# Altium schematic sheet LTC6952_1.SchDoc
size A3
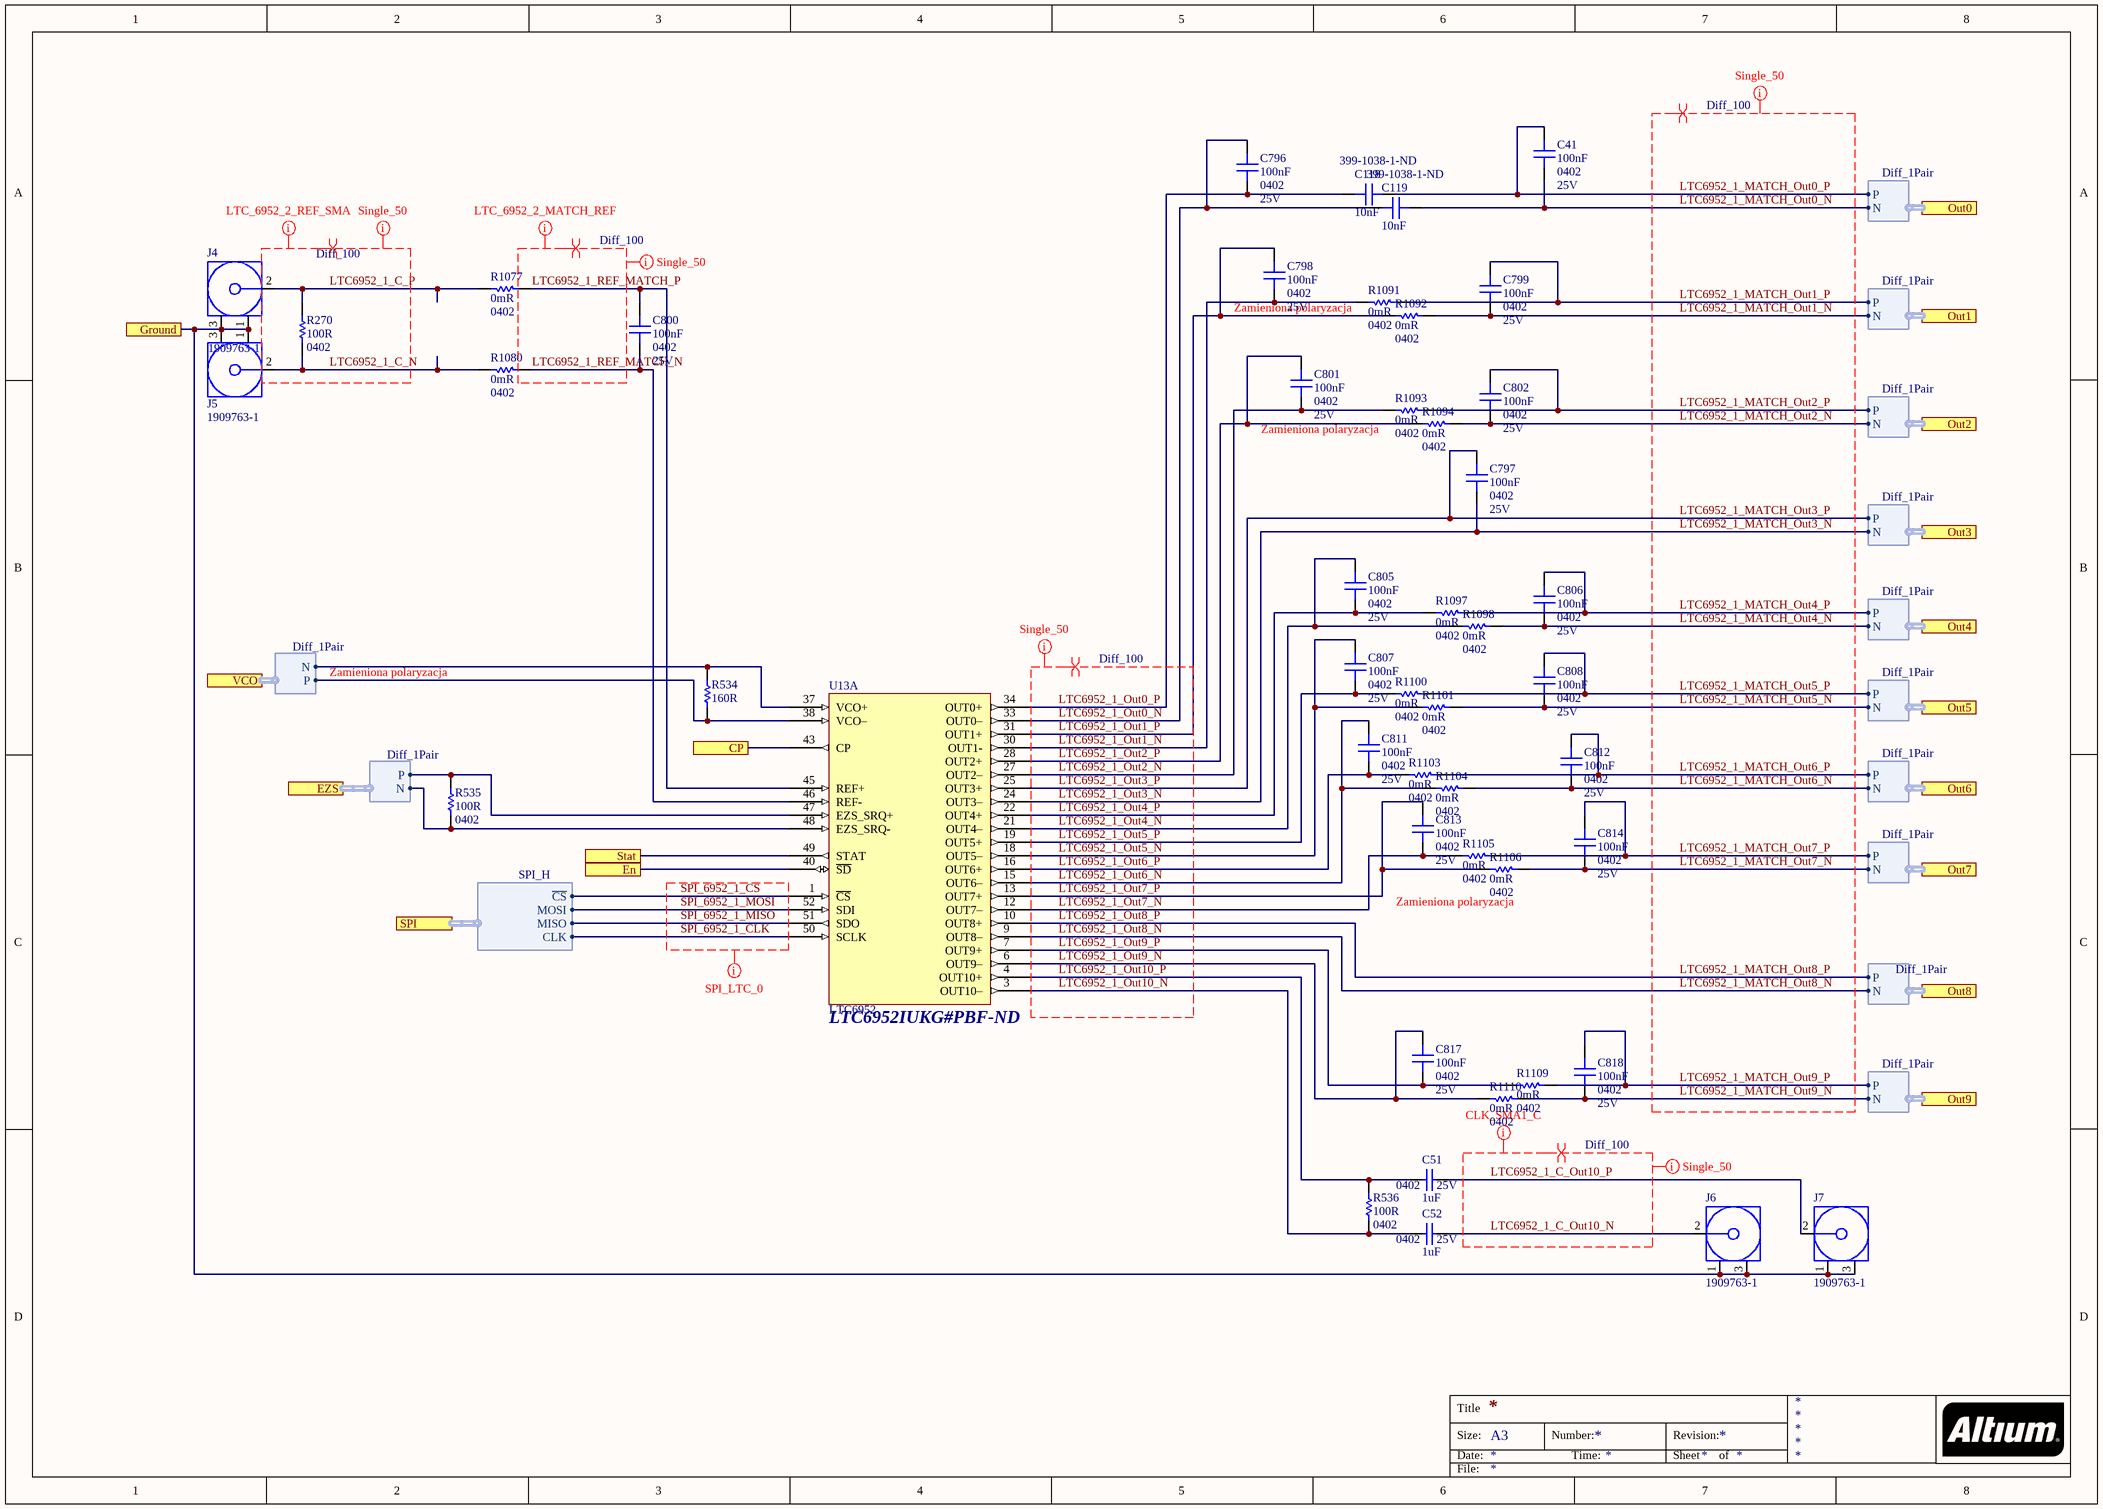
[diagram p0: LTC6952_1.SchDoc]

## Parts
C41  100nF  Case/Package: 0402  Voltage Rating: 25V  [CAP 0402/1005 KK]
C51  1uF  Case/Package: 0402  Voltage Rating: 25V  [CAP 0402/1005 KK]
C52  1uF  Case/Package: 0402  Voltage Rating: 25V  [CAP 0402/1005 KK]
C118  10nF  Supplier Part Number 1: 399-1038-1-ND  [CAP 0402/1005 KK]
C119  10nF  Supplier Part Number 1: 399-1038-1-ND  [CAP 0402/1005 KK]
C796  100nF  Case/Package: 0402  Voltage Rating: 25V  [CAP 0402/1005 KK]
C797  100nF  Case/Package: 0402  Voltage Rating: 25V  [CAP 0402/1005 KK]
C798  100nF  Case/Package: 0402  Voltage Rating: 25V  [CAP 0402/1005 KK]
C799  100nF  Case/Package: 0402  Voltage Rating: 25V  [CAP 0402/1005 KK]
C800  100nF  Case/Package: 0402  Voltage Rating: 25V  [CAP 0402/1005 KK]
C801  100nF  Case/Package: 0402  Voltage Rating: 25V  [CAP 0402/1005 KK]
C802  100nF  Case/Package: 0402  Voltage Rating: 25V  [CAP 0402/1005 KK]
C805  100nF  Case/Package: 0402  Voltage Rating: 25V  [CAP 0402/1005 KK]
C806  100nF  Case/Package: 0402  Voltage Rating: 25V  [CAP 0402/1005 KK]
C807  100nF  Case/Package: 0402  Voltage Rating: 25V  [CAP 0402/1005 KK]
C808  100nF  Case/Package: 0402  Voltage Rating: 25V  [CAP 0402/1005 KK]
C811  100nF  Case/Package: 0402  Voltage Rating: 25V  [CAP 0402/1005 KK]
C812  100nF  Case/Package: 0402  Voltage Rating: 25V  [CAP 0402/1005 KK]
C813  100nF  Case/Package: 0402  Voltage Rating: 25V  [CAP 0402/1005 KK]
C814  100nF  Case/Package: 0402  Voltage Rating: 25V  [CAP 0402/1005 KK]
C817  100nF  Case/Package: 0402  Voltage Rating: 25V  [CAP 0402/1005 KK]
C818  100nF  Case/Package: 0402  Voltage Rating: 25V  [CAP 0402/1005 KK]
J4  1909763-1  [TECO-1909763-1_V]
J5  1909763-1  [TECO-1909763-1_V]
J6  1909763-1  [TECO-1909763-1_V]
J7  1909763-1  [TECO-1909763-1_V]
R270  100R  Case/Package: 0402  [RES 0402/1005 RF KK]
R534  160R  [RES 0402/1005 RF KK]
R535  100R  Case/Package: 0402  [RES 0402/1005 RF KK]
R536  100R  Case/Package: 0402  [RES 0402/1005 RF KK]
R1077  0mR  Case/Package: 0402  [RES 0402/1005 RF KK]
R1080  0mR  Case/Package: 0402  [RES 0402/1005 RF KK]
R1091  0mR  Case/Package: 0402  [RES 0402/1005 RF KK]
R1092  0mR  Case/Package: 0402  [RES 0402/1005 RF KK]
R1093  0mR  Case/Package: 0402  [RES 0402/1005 RF KK]
R1094  0mR  Case/Package: 0402  [RES 0402/1005 RF KK]
R1097  0mR  Case/Package: 0402  [RES 0402/1005 RF KK]
R1098  0mR  Case/Package: 0402  [RES 0402/1005 RF KK]
R1100  0mR  Case/Package: 0402  [RES 0402/1005 RF KK]
R1101  0mR  Case/Package: 0402  [RES 0402/1005 RF KK]
R1103  0mR  Case/Package: 0402  [RES 0402/1005 RF KK]
R1104  0mR  Case/Package: 0402  [RES 0402/1005 RF KK]
R1105  0mR  Case/Package: 0402  [RES 0402/1005 RF KK]
R1106  0mR  Case/Package: 0402  [RES 0402/1005 RF KK]
R1109  0mR  Case/Package: 0402  [RES 0402/1005 RF KK]
R1110  0mR  Case/Package: 0402  [RES 0402/1005 RF KK]
U13  LTC6952  Supplier Part Number 1: LTC6952IUKG#PBF-ND  [LTC6952]  (part A of 2)

## Ports
CP, En, EZS (harness Diff_1Pair), Ground, Out0 (harness Diff_1Pair), Out1 (harness Diff_1Pair), Out2 (harness Diff_1Pair), Out3 (harness Diff_1Pair), Out4 (harness Diff_1Pair), Out5 (harness Diff_1Pair), Out6 (harness Diff_1Pair), Out7 (harness Diff_1Pair), Out8 (harness Diff_1Pair), Out9 (harness Diff_1Pair), SPI (harness SPI_H), Stat, VCO (harness Diff_1Pair)

## Harnesses
SPI_H: CLK, MISO, MOSI, ~{CS}
Diff_1Pair: N, P

## Nets
CP: U13.43(CP) ; port CP
En: U13.40(~{SD}) ; port En
Ground: J4.1 J4.3 J5.1 J5.3 J6.1 J6.3 J7.1 J7.3 ; port Ground
LTC6952_1_C_N: J5.2 R270.1 R1080.2
LTC6952_1_C_Out10_N: C52.1 J6.2
LTC6952_1_C_Out10_P: C51.1 J7.2
LTC6952_1_C_P: J4.2 R270.2 R1077.2
LTC6952_1_MATCH_Out0_N: C41.2 C119.2 ; port Out0.N
LTC6952_1_MATCH_Out0_P: C41.1 C118.2 ; port Out0.P
LTC6952_1_MATCH_Out1_N: C799.2 R1092.1 ; port Out1.N
LTC6952_1_MATCH_Out1_P: C799.1 R1091.1 ; port Out1.P
LTC6952_1_MATCH_Out2_N: C802.2 R1094.1 ; port Out2.N
LTC6952_1_MATCH_Out2_P: C802.1 R1093.1 ; port Out2.P
LTC6952_1_MATCH_Out3_N: C797.2 U13.24(OUT3–) ; port Out3.N  [also labelled LTC6952_1_Out3_N]
LTC6952_1_MATCH_Out3_P: C797.1 U13.25(OUT3+) ; port Out3.P  [also labelled LTC6952_1_Out3_P]
LTC6952_1_MATCH_Out4_N: C806.2 R1098.1 ; port Out4.N
LTC6952_1_MATCH_Out4_P: C806.1 R1097.1 ; port Out4.P
LTC6952_1_MATCH_Out5_N: C808.2 R1101.1 ; port Out5.N
LTC6952_1_MATCH_Out5_P: C808.1 R1100.1 ; port Out5.P
LTC6952_1_MATCH_Out6_N: C812.2 R1104.1 ; port Out6.N
LTC6952_1_MATCH_Out6_P: C812.1 R1103.1 ; port Out6.P
LTC6952_1_MATCH_Out7_N: C814.2 R1106.1 ; port Out7.N
LTC6952_1_MATCH_Out7_P: C814.1 R1105.1 ; port Out7.P
LTC6952_1_MATCH_Out8_N: U13.9(OUT8–) ; port Out8.N  [also labelled LTC6952_1_Out8_N]
LTC6952_1_MATCH_Out8_P: U13.10(OUT8+) ; port Out8.P  [also labelled LTC6952_1_Out8_P]
LTC6952_1_MATCH_Out9_N: C818.2 R1110.1 ; port Out9.N
LTC6952_1_MATCH_Out9_P: C818.1 R1109.1 ; port Out9.P
LTC6952_1_Out0_N: C119.1 C796.1 U13.33(OUT0–)
LTC6952_1_Out0_P: C118.1 C796.2 U13.34(OUT0+)
LTC6952_1_Out1_N: C798.2 R1091.2 U13.30(OUT1-)
LTC6952_1_Out1_P: C798.1 R1092.2 U13.31(OUT1+)
LTC6952_1_Out2_N: C801.2 R1093.2 U13.27(OUT2–)
LTC6952_1_Out2_P: C801.1 R1094.2 U13.28(OUT2+)
LTC6952_1_Out4_N: C805.1 R1098.2 U13.21(OUT4–)
LTC6952_1_Out4_P: C805.2 R1097.2 U13.22(OUT4+)
LTC6952_1_Out5_N: C807.1 R1101.2 U13.18(OUT5–)
LTC6952_1_Out5_P: C807.2 R1100.2 U13.19(OUT5+)
LTC6952_1_Out6_N: C811.1 R1104.2 U13.15(OUT6–)
LTC6952_1_Out6_P: C811.2 R1103.2 U13.16(OUT6+)
LTC6952_1_Out7_N: C813.2 R1105.2 U13.12(OUT7–)
LTC6952_1_Out7_P: C813.1 R1106.2 U13.13(OUT7+)
LTC6952_1_Out9_N: C817.1 R1110.2 U13.6(OUT9–)
LTC6952_1_Out9_P: C817.2 R1109.2 U13.7(OUT9+)
LTC6952_1_Out10_N: C52.2 R536.1 U13.3(OUT10–)
LTC6952_1_Out10_P: C51.2 R536.2 U13.4(OUT10+)
LTC6952_1_REF_MATCH_N: C800.2 R1080.1 U13.46(REF-)
LTC6952_1_REF_MATCH_P: C800.1 R1077.1 U13.45(REF+)
SPI_6952_1_CLK: U13.50(SCLK) ; port SPI.CLK
SPI_6952_1_CS: U13.1(~{CS}) ; port SPI.~{CS}
SPI_6952_1_MISO: U13.51(SDO) ; port SPI.MISO
SPI_6952_1_MOSI: U13.52(SDI) ; port SPI.MOSI
Stat: U13.49(STAT) ; port Stat
NetR534_1: R534.1 U13.38(VCO–) ; port VCO.P
NetR534_2: R534.2 U13.37(VCO+) ; port VCO.N
NetR535_1: R535.1 U13.48(EZS_SRQ-) ; port EZS.N
NetR535_2: R535.2 U13.47(EZS_SRQ+) ; port EZS.P

## Layout directives
differential pair; differential pair class Diff_100: LTC6952_1_C_N, LTC6952_1_C_Out10_N, LTC6952_1_C_Out10_P, LTC6952_1_C_P, LTC6952_1_MATCH_Out0_N, LTC6952_1_MATCH_Out0_P, LTC6952_1_MATCH_Out1_N, LTC6952_1_MATCH_Out1_P, LTC6952_1_MATCH_Out2_N, LTC6952_1_MATCH_Out2_P, LTC6952_1_MATCH_Out3_N, LTC6952_1_MATCH_Out3_P, LTC6952_1_MATCH_Out4_N, LTC6952_1_MATCH_Out4_P, LTC6952_1_MATCH_Out5_N, LTC6952_1_MATCH_Out5_P, LTC6952_1_MATCH_Out6_N, LTC6952_1_MATCH_Out6_P, LTC6952_1_MATCH_Out7_N, LTC6952_1_MATCH_Out7_P, LTC6952_1_MATCH_Out8_N, LTC6952_1_MATCH_Out8_P, LTC6952_1_MATCH_Out9_N, LTC6952_1_MATCH_Out9_P, LTC6952_1_Out0_N, LTC6952_1_Out0_P, LTC6952_1_Out1_N, LTC6952_1_Out1_P, LTC6952_1_Out2_N, LTC6952_1_Out2_P, LTC6952_1_Out3_N, LTC6952_1_Out3_P, LTC6952_1_Out4_N, LTC6952_1_Out4_P, LTC6952_1_Out5_N, LTC6952_1_Out5_P, LTC6952_1_Out6_N, LTC6952_1_Out6_P, LTC6952_1_Out7_N, LTC6952_1_Out7_P, LTC6952_1_Out8_N, LTC6952_1_Out8_P, LTC6952_1_Out9_N, LTC6952_1_Out9_P, LTC6952_1_Out10_N, LTC6952_1_Out10_P, LTC6952_1_REF_MATCH_N, LTC6952_1_REF_MATCH_P
net class LTC_6952_2_REF_SMA: LTC6952_1_C_N, LTC6952_1_C_P
net class Single_50: LTC6952_1_C_N, LTC6952_1_C_Out10_N, LTC6952_1_C_Out10_P, LTC6952_1_C_P, LTC6952_1_MATCH_Out0_N, LTC6952_1_MATCH_Out0_P, LTC6952_1_MATCH_Out1_N, LTC6952_1_MATCH_Out1_P, LTC6952_1_MATCH_Out2_N, LTC6952_1_MATCH_Out2_P, LTC6952_1_MATCH_Out3_N, LTC6952_1_MATCH_Out3_P, LTC6952_1_MATCH_Out4_N, LTC6952_1_MATCH_Out4_P, LTC6952_1_MATCH_Out5_N, LTC6952_1_MATCH_Out5_P, LTC6952_1_MATCH_Out6_N, LTC6952_1_MATCH_Out6_P, LTC6952_1_MATCH_Out7_N, LTC6952_1_MATCH_Out7_P, LTC6952_1_MATCH_Out8_N, LTC6952_1_MATCH_Out8_P, LTC6952_1_MATCH_Out9_N, LTC6952_1_MATCH_Out9_P, LTC6952_1_Out0_N, LTC6952_1_Out0_P, LTC6952_1_Out1_N, LTC6952_1_Out1_P, LTC6952_1_Out2_N, LTC6952_1_Out2_P, LTC6952_1_Out3_N, LTC6952_1_Out3_P, LTC6952_1_Out4_N, LTC6952_1_Out4_P, LTC6952_1_Out5_N, LTC6952_1_Out5_P, LTC6952_1_Out6_N, LTC6952_1_Out6_P, LTC6952_1_Out7_N, LTC6952_1_Out7_P, LTC6952_1_Out8_N, LTC6952_1_Out8_P, LTC6952_1_Out9_N, LTC6952_1_Out9_P, LTC6952_1_Out10_N, LTC6952_1_Out10_P, LTC6952_1_REF_MATCH_N, LTC6952_1_REF_MATCH_P
net class CLK_SMA1_C: LTC6952_1_C_Out10_N, LTC6952_1_C_Out10_P
net class LTC_6952_2_MATCH_REF: LTC6952_1_REF_MATCH_N, LTC6952_1_REF_MATCH_P
net class SPI_LTC_0: SPI_6952_1_CLK, SPI_6952_1_CS, SPI_6952_1_MISO, SPI_6952_1_MOSI

## Notes on the sheet
- (near R1091) Zamieniona polaryzacja
- (near R1093) Zamieniona polaryzacja
- Zamieniona polaryzacja
- Title
- Size:
- Date:
- A3
- Number:
- Time:
- Revision:
- Sheet
- of
- File:

## Library data of the parts
C41 C796-C802 C805-C808 C811-C814 C817 C818 = Capacitor: Manufacturer: Murata; Manufacturer Part Number: GRM155R71E104KE14J; Tolerance: 10%; Dielectric: X7R; Supplier 1: Digi-Key; Supplier Part Number 1: 490-14603-1-ND; Stock 1: 89275; Pricing 1: 1 = 0,10000, 10 = 0,03400, 100 = 0,01520, 500 = 0,01088, 1000 = 0,00855, 2500 = 0,00778, 5000 = 0,00715 (USD); RoHS: Yes; Mount: Surface Mount; Weight: 0.000212oz; Case Code (Imperial): 0402; Case Code (Metric): 1005; Min Operating Temperature: -55°C; Max Operating Temperature: 125°C; Packaging: Tape and Reel; Capacitance: 100nF; Termination: SMD/SMT; Composition: Ceramic; Voltage Rating (DC): 25V; Package Quantity: 50000; Length: 0.039inch; Height: 0.5mm; Width: 0.5mm; Thickness: 0.022inch; ComponentLink1URL: http://www.mouser.com/ds/2/281/c02e-2905.pdf?src-supplier=Mouser; ComponentLink1Description: http://www.mouser.com/ds/2/281/c02e-2905.pdf?src-supplier=Mouser; ComponentLink2URL: http://search.murata.co.jp/Ceramy/image/img/A01X/G101/ENG/GRM155R71E104KE14-01.pdf?src-supplier=Digi-Key; ComponentLink2Description: http://search.murata.co.jp/Ceramy/image/img/A01X/G101/ENG/GRM155R71E104KE14-01.pdf?src-supplier=Digi-Key
C51 C52 = Capacitor: MURATA - GRT155R61E105KE01D - SMD Multilayer Ceramic Capacitor, 1 µF, 25 V, 0402 [1005 Metric], ± 10%, X5R, GRT Series - SMD Multilayer Ceramic Capacitor, 1 µF, 25 V, 0402 [1005 Metric], ± 10%, X5R, GRT Series; Supplier 1: Digi-Key; Supplier Part Number 1: 490-12263-1-ND; Manufacturer: Murata; Manufacturer Part Number: GRT155R61E105KE01D; RoHS: Yes; Category: Ceramic Capacitors; Stock 1: 341453; Pricing 1: 1=0,18000, 10=0,12300, 100=0,06210, 500=0,04248, 1000=0,03758, 2500=0,03594, 5000=0,03268 (USD); Mount: Surface Mount; Case Code (Metric): 1005; Case Code (Imperial): 0402; Min Operating Temperature: -55°C; Max Operating Temperature: 85°C; Packaging: Tape and Reel; Capacitance: 1uF; Tolerance: 10%; Dielectric: X5R; Voltage Rating (DC): 25V; Length: 0.039inch; Width: 0.02inch; Thickness: 0.022inch; Ratings: AEC-Q200; ComponentLink1URL: http://www.farnell.com/datasheets/2165918.pdf?src-supplier=Farnell; ComponentLink1Description: http://www.farnell.com/datasheets/2165918.pdf?src-supplier=Farnell; ComponentLink2URL: http://search.murata.co.jp/Ceramy/image/img/A01X/G101/ENG/GRT155R61E105KE01-01.pdf?src-supplier=Digi-Key; ComponentLink2Description: http://search.murata.co.jp/Ceramy/image/img/A01X/G101/ENG/GRT155R61E105KE01-01.pdf?src-supplier=Digi-Key; ComponentLink3URL: http://www.farnell.com/datasheets/2165918.pdf?src-supplier=Element14; ComponentLink3Description: http://www.farnell.com/datasheets/2165918.pdf?src-supplier=Element14
C118 C119 = Capacitor: Manufacturer: KEMET; Manufacturer Part Number: C0402C103K4RACTU; Dielectric Material: Ceramic; Tolerance: 10%; Voltage Rating (DC): 16V; Dielectric: X7R; Dissipation Factor: 3.5%; Supplier 1: Digi-Key; Stock 1: 1112674; Pricing 1: 1 = 0,10000, 10 = 0,02800, 100 = 0,01240, 500 = 0,00886, 1000 = 0,00696, 2500 = 0,00632, 5000 = 0,00582 (USD); RoHS: Yes; Mount: Surface Mount,PCB; Case/Package: 0402; Number of Pins: 2; Case Code (Metric): 1005; Case Code (Imperial): 0402; Contact Plating: Tin,Matte; Min Operating Temperature: -55°C; Max Operating Temperature: 125°C; Capacitance: 10nF; Packaging: Tape and Reel; Package Quantity: 1; Voltage Rating: 16V; Termination: SMD/SMT; Voltage: 16V; Length: 1mm; Height: 0.5mm; Width: 0.02inch; Depth: 0.5mm; Thickness: 0.022inch; Lead Pitch: 0.3mm; Radiation Hardening: No; REACH SVHC: No SVHC; ComponentLink1URL: https://datasheet.ciiva.com/14595/70095383-14595321.pdf?src-supplier=Allied+Electronics; ComponentLink1Description: https://datasheet.ciiva.com/14595/70095383-14595321.pdf?src-supplier=Allied+Electronics; ComponentLink2URL: https://datasheet.ciiva.com/7747/kem-c1002-x7r-smd-7747614.pdf?src-supplier=Element14; ComponentLink2Description: https://datasheet.ciiva.com/7747/kem-c1002-x7r-smd-7747614.pdf?src-supplier=Element14
J4-J7 = 1909763-1: Ultra Miniature Coaxial Connector Jack, 60 V, 50 Ohm, -40 to 90 degC, RoHS, Tape and Reel; Brand: TE Connectivity / AMP; Maximum Frequency: 6 GHz; Gender: Jack (Female); Body Material: Liquid Crystal Polymer (LCP); RF Series: UMCC; Impedance: 50 Ohms; DatasheetVersion: Rev. B2; PackageReference: SMD; PackageDescription: 3-Pin Surface Mount Device, Body 2.6 x 2.6 mm; Supplier 1: Newark; Supplier Part Number 1: 62X0488; Supplier 2: Farnell; Supplier Part Number 2: 2781689; Supplier 3: Digi-Key; Supplier Part Number 3: A118077TR-ND; Supplier 4: Digi-Key; Supplier Part Number 4: A118077CT-ND; Supplier 5: Digi-Key; Supplier Part Number 5: A118077DKR-ND; Product Category: RF Connectors / Coaxial Connectors; Packaging: Reel; Product: Connectors; Orientation: Straight; Operating Temperature Range: - 40 C to + 90 C; Factory Pack Quantity: 5000; RoHS: Details; Contact Plating: Gold; Contact Material: Copper Alloy; Mounting Technology: Surface Mount; ComponentLink1Description: Manufacturer URL; ComponentLink1URL: http://www.te.com; ComponentLink2Description: Datasheet; ComponentLink2URL: http://www.te.com/commerce/DocumentDelivery/DDEController?Action=srchrtrv&DocNm=1909763&DocType=Customer+Drawing&DocLang=English
R270 R535 R536 = Resistor: RES SMD 100 OHM 1% 1/16W 0402; Manufacturer: Yageo; Manufacturer Part Number: RC0402FR-07100RL; Power Rating: 62.5mW; Voltage Rating: 50V; Temperature Coefficient: 100ppm/°C; Supplier 1: Digi-Key; Supplier Part Number 1: 311-100LRDKR-ND; RoHS: Yes; Category: Chip SMD Resistors; Stock 1: 42078262; Pricing 1: 1=0,10000, 10=0,01600, 100=0,00640, 1000=0,00289, 2500=0,00251, 5000=0,00207 (USD); Number of Pins: 2; Case Code (Imperial): 0402; Case Code (Metric): 1005; Min Operating Temperature: -55°C; Max Operating Temperature: 155°C; Tolerance: 1%; Resistance: 100R; Packaging: Tape and Reel; Termination: SMD/SMT; Composition: Thick Film; Military Standard: Not; Voltage Rating (DC): 50V; Length: 1mm; Height: 0.32mm; Depth: 0.5mm; Width: 0.5mm; REACH SVHC: No SVHC; Lead Free: Lead Free; ComponentLink1URL: https://datasheet.ciiva.com/7849/1784430-7849810.pdf?src-supplier=Element14; ComponentLink1Description: https://datasheet.ciiva.com/7849/1784430-7849810.pdf?src-supplier=Element14; ComponentLink2URL: https://datasheet.ciiva.com/11808/0900766b80c66297-11808765.pdf?src-supplier=RSComponents; ComponentLink2Description: https://datasheet.ciiva.com/11808/0900766b80c66297-11808765.pdf?src-supplier=RSComponents; ComponentLink3URL: https://datasheet.ciiva.com/12667/pyu-rc0402-51-rohs-l-6-r-12667957.pdf?src-supplier=Mouser; ComponentLink3Description: https://datasheet.ciiva.com/12667/pyu-rc0402-51-rohs-l-6-r-12667957.pdf?src-supplier=Mouser; ComponentLink4URL: https://datasheet.ciiva.com/16740/pyu-rc0402-51-rohs-l-6-r-16740566.pdf?src-supplier=Future+Electronics; ComponentLink4Description: https://datasheet.ciiva.com/16740/pyu-rc0402-51-rohs-l-6-r-16740566.pdf?src-supplier=Future+Electronics; ComponentLink5URL: https://datasheet.ciiva.com/15189/getdatasheetpartid-329466-15189335.pdf?src-supplier=Verical; ComponentLink5Description: https://datasheet.ciiva.com/15189/getdatasheetpartid-329466-15189335.pdf?src-supplier=Verical; ComponentLink6URL: https://datasheet.ciiva.com/28367/1018594-28367226.pdf?src-supplier=Element14; ComponentLink6Description: https://datasheet.ciiva.com/28367/1018594-28367226.pdf?src-supplier=Element14; ComponentLink7URL: https://datasheet.ciiva.com/22747/1018594-22747511.pdf?src-supplier=Element14; ComponentLink7Description: https://datasheet.ciiva.com/22747/1018594-22747511.pdf?src-supplier=Element14
R534 = Resistor: Res Thick Film 0402 160 Ohm 1% 1/16W 100ppm/C Molded SMD SMD Paper T/R; Manufacturer: Stackpole Electronics; Manufacturer Part Number: RMCF0402FT160R; Temperature Coefficient: 100ppm/°C; Supplier 1: Digi-Key; Supplier Part Number 1: RMCF0402FT160RCT-ND; RoHS: Yes; Category: Chip SMD Resistors; Stock 1: 34661; Pricing 1: 1=0,10000, 10=0,01400, 100=0,00580, 1000=0,00262, 2500=0,00228, 5000=0,00188 (USD); Mount: Surface Mount; Case/Package: 0402; Contact Plating: Tin,Matte; Min Operating Temperature: -55°C; Max Operating Temperature: 155°C; Packaging: Tape and Reel; Resistance: 160R; Tolerance: 1%; Composition: Thick Film; Radiation Hardening: No; ComponentLink1URL: https://www.seielect.com/catalog/SEI-RMCF_RMCP.pdf?src-supplier=Avnet; ComponentLink1Description: https://www.seielect.com/catalog/SEI-RMCF_RMCP.pdf?src-supplier=Avnet
R1077 R1080 R1091-R1094 R1097 R1098 R1100 R1101 R1103-R1106 R1109 R1110 = Resistor: Manufacturer 1: Yageo; Manufacturer Part Number 1: RC0402JR-070RL; Power Rating: 62.5mW; Tolerance: 5%; Voltage Rating: 50V; Max Power Dissipation: 63mW; Temperature Coefficient: 200ppm/°C; Supplier 1: Digi-Key; Supplier Part Number 1: 311-0.0JRCT-ND; Stock 1: 69822252; Pricing 1: 1=0.10000, 10=0.01200, 25=0.00920, 50=0.00680, 100=0.00510, 250=0.00388, 500=0.00308, 1000=0.00227, 5000=0.00163 (USD); RoHS: Yes; Contact Plating: Tin,Matte; Case Code (Metric): 1005; Case Code (Imperial): 0402; Min Operating Temperature: -55°C; Max Operating Temperature: 155°C; Resistance: 0mR; Packaging: Tape and Reel; Composition: Thick Film; Package Quantity: 1; Number of Terminations: 2; Termination: SMD/SMT; Military Standard: Not; Features: Moisture Resistant; Length: 1mm; Height: 0.016inch; Width: 0.02inch; Depth: 0.5mm; Radiation Hardening: No; REACH SVHC: Unknown; Lead Free: Lead Free; ComponentLink1URL: https://datasheet.ciiva.com/2452/pyu-rc0402-51-rohs-l-6-2452608.pdf?src-supplier=Digi-Key; ComponentLink1Description: https://datasheet.ciiva.com/2452/pyu-rc0402-51-rohs-l-6-2452608.pdf?src-supplier=Digi-Key; ComponentLink2URL: https://datasheet.ciiva.com/11808/0900766b80c66297-11808195.pdf?src-supplier=RSComponents; ComponentLink2Description: https://datasheet.ciiva.com/11808/0900766b80c66297-11808195.pdf?src-supplier=RSComponents; ComponentLink3URL: https://datasheet.ciiva.com/2452/pyu-r-int-thick-7-2452609.pdf?src-supplier=Digi-Key; ComponentLink3Description: https://datasheet.ciiva.com/2452/pyu-r-int-thick-7-2452609.pdf?src-supplier=Digi-Key; ComponentLink4URL: https://datasheet.ciiva.com/22747/1018594-22747515.pdf?src-supplier=Element14; ComponentLink4Description: https://datasheet.ciiva.com/22747/1018594-22747515.pdf?src-supplier=Element14; ComponentLink5URL: https://datasheet.ciiva.com/7983/1018594-7983535.pdf?src-supplier=Element14; ComponentLink5Description: https://datasheet.ciiva.com/7983/1018594-7983535.pdf?src-supplier=Element14; ComponentLink6URL: https://datasheet.ciiva.com/2452/pyu-r-int-thick-7-2452610.pdf?src-supplier=Digi-Key; ComponentLink6Description: https://datasheet.ciiva.com/2452/pyu-r-int-thick-7-2452610.pdf?src-supplier=Digi-Key; ComponentLink7URL: https://datasheet.ciiva.com/8896/pyu-rc0402-51-rohs-l-6-8896201.pdf?src-supplier=Avnet; ComponentLink7Description: https://datasheet.ciiva.com/8896/pyu-rc0402-51-rohs-l-6-8896201.pdf?src-supplier=Avnet; ComponentLink8URL: https://datasheet.ciiva.com/28386/pyu-rc0402-51-rohs-l-6-28386633.pdf?src-supplier=Avnet+Europe; ComponentLink8Description: https://datasheet.ciiva.com/28386/pyu-rc0402-51-rohs-l-6-28386633.pdf?src-supplier=Avnet+Europe; ComponentLink9URL: https://datasheet.ciiva.com/15189/getdatasheetpartid-326379-15189533.pdf?src-supplier=Verical; ComponentLink9Description: https://datasheet.ciiva.com/15189/getdatasheetpartid-326379-15189533.pdf?src-supplier=Verical
U13 = LTC6952: Dystrybutor Zegarów; Manufacturer: Analog Devices; Manufacturer Part Number: LTC6952IUKG#PBF; Supplier 1: Digi-Key; Stock 1: 267; Pricing 1: 1 = 30,78000, 25 = 24,62680, 100 = 21,36000, 250 = 20,50564, 500 = 19,86492 (USD); RoHS: No; Number of Pins: 52